# Altium project Bracelet_Aux_v1.0.PrjPcb
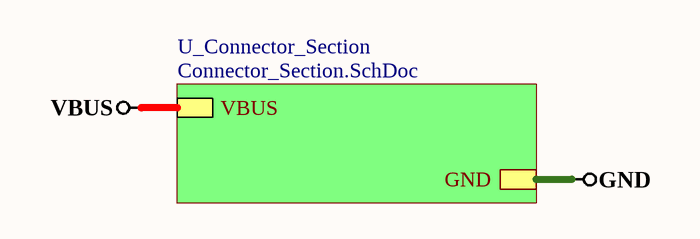
[diagram p0: Top_Sheet.SchDoc]
2 sheets, 9 parts. Net scope: hierarchical (ports join the sheet entries above them; power ports are global).
Board file: Bracelet_Aux_v1.0.PcbDoc
Sheets:
  Top_Sheet.SchDoc
    U_Connector_Section = Connector_Section.SchDoc

## Sheet Top_Sheet.SchDoc
size A4; DocumentNumber: 1; SheetNumber: 1; SheetTotal: 2

### Sub-sheets
U_Connector_Section = Connector_Section.SchDoc: GND, VBUS

## Sheet Connector_Section.SchDoc
size A4; DocumentNumber: 2; SheetNumber: 2; SheetTotal: 2
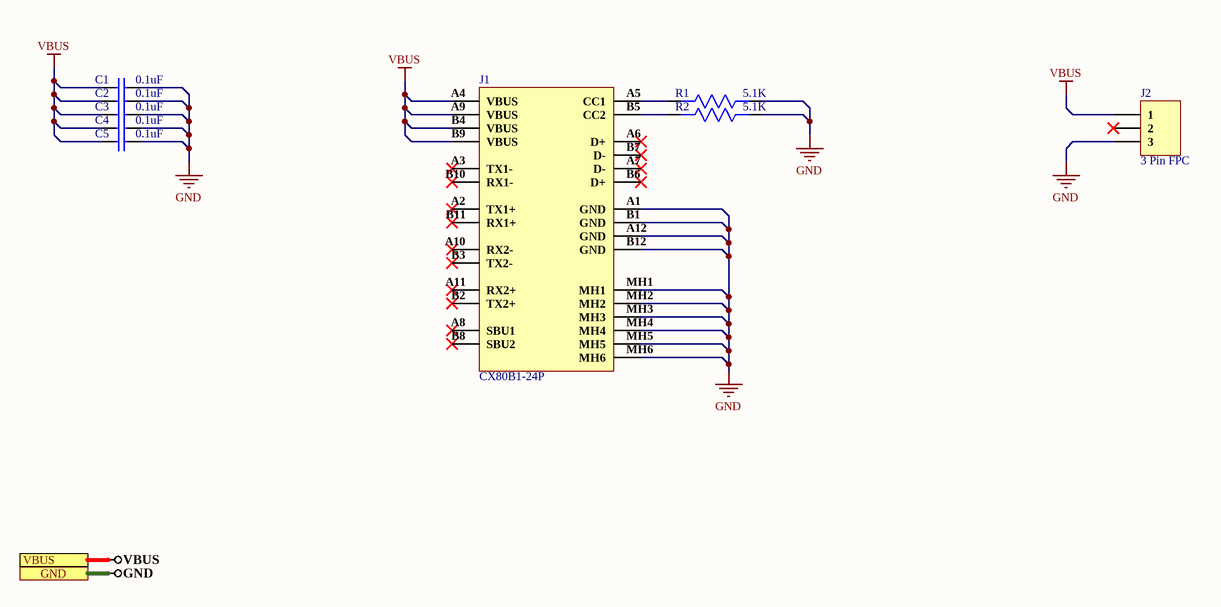
[diagram p1: Connector_Section.SchDoc]

### Parts
C1  0.1uF  [CAP 0201]
C2  0.1uF  [CAP 0201]
C3  0.1uF  [CAP 0201]
C4  0.1uF  [CAP 0201]
C5  0.1uF  [CAP 0201]
J1  CX80B1-24P  [CX80B1-24P]
J2  3 Pin FPC  [3 Pin FPC]
R1  5.1K  [Res-0201]
R2  5.1K  [Res-0201]

### Ports
GND, VBUS

### Nets
GND: C1.2 C2.2 C3.2 C4.2 C5.2 J1.A1(GND) J1.A12(GND) J1.B1(GND) J1.B12(GND) J1.MH1 J1.MH2 J1.MH3 J1.MH4 J1.MH5 J1.MH6 J2.3 R1.1 R2.1 ; port GND
VBUS: C1.1 C2.1 C3.1 C4.1 C5.1 J1.A4(VBUS) J1.A9(VBUS) J1.B4(VBUS) J1.B9(VBUS) J2.1 ; port VBUS
NetJ1_A5: J1.A5(CC1) R1.2
NetJ1_B5: J1.B5(CC2) R2.2

Not connected (* = marked no-connect by the designer): J1 A2(TX1+)* A3(TX1-)* A6(D+)* A7(D-)* A8(SBU1)* A10(RX2-)* A11(RX2+)* B2(TX2+)* B3(TX2-)* B6(D+)* B7(D-)* B8(SBU2)* B10(RX1-)* B11(RX1+)*; J2 2*

### Library data of the parts
C1-C5 = GRM033R61E104KE14D: Multilayer Ceramic Capacitors MLCC - SMD/SMT 0201 0.1uF 25volts X5R 10%; Manufacturer: Murata; Capacitance: 100nF; Voltage Rating: 25V; Supplier 1: Mouser; Manufacturer Part Number: GRM033R61E104KE14D; RoHS: Yes; Category: Ceramic Capacitors; Stock 1: 22478; Pricing 1: 1=0.10000, 10=0.03100, 50=0.03100, 100=0.02500, 1000=0.01700, 10000=0.01400 (USD); Mount: Surface Mount; Case/Package: 0201; Case Code (Metric): 0603; Case Code (Imperial): 0201; Weight: 1.2E-05oz; Min Operating Temperature: -55°C; Max Operating Temperature: 85°C; Packaging: Tape and Reel; Tolerance: 10%; Dielectric: X5R; Termination: SMD/SMT; Resistor Type: Ceramic; Voltage Rating (DC): 25V; Package Quantity: 15000; Length: 0.024inch; Width: 0.012inch; Height: 0.3mm; Thickness: 0.013inch; Lead Free: Lead Free; RoHS Compliant: Yes; ComponentLink1URL: http://www.farnell.com/datasheets/2867843.pdf?src-supplier=Farnell; ComponentLink1Description: http://www.farnell.com/datasheets/2867843.pdf?src-supplier=Farnell; ComponentLink2URL: http://www.mouser.com/ds/2/281/c02e-2905.pdf?src-supplier=Mouser; ComponentLink2Description: http://www.mouser.com/ds/2/281/c02e-2905.pdf?src-supplier=Mouser; ComponentLink3URL: http://search.murata.co.jp/Ceramy/image/img/A01X/G101/ENG/GRM033R61E104KE14-01.pdf?src-supplier=Digi-Key; ComponentLink3Description: http://search.murata.co.jp/Ceramy/image/img/A01X/G101/ENG/GRM033R61E104KE14-01.pdf?src-supplier=Digi-Key; ComponentLink4URL: http://www.farnell.com/datasheets/2867843.pdf?src-supplier=Newark; ComponentLink4Description: http://www.farnell.com/datasheets/2867843.pdf?src-supplier=Newark; Supplier Part Number 1: 81-GRM033R61E104KE4D
J1 = CX80B1-24P: CONN RCPT USB3.1 TYPE C SMT VERT; Manufacturer: Hirose; Connector Type: USB; Number of Contacts: 24; Gender: Receptacle; Number of Ports: 1; Current Rating: 1.25A; Mating Cycles: 10000; Shielding: Shielded; Supplier 1: Digi-Key; Manufacturer Part Number: CX80B1-24P; RoHS: Yes; Category: Connectors; Stock 1: 1; Pricing 1: 1=3.23000, 10=3.09600, 25=2.83800, 50=2.70900, 100=2.58000, 250=2.25752 (USD); Mount: Surface Mount,Through Hole; Contact Plating: Gold; Insulation Color: Black; Min Operating Temperature: -40°C; Max Operating Temperature: 85°C; Packaging: Cut Tape; Termination: Solder; Flammability Rating: UL94 V-0; ComponentLink1URL: https://www.hirose.com/product/download/?distributor=digikey&amp;type=2d&amp;lang=en&amp;num=CX80B1-24P&src-supplier=Digi-Key; ComponentLink1Description: https://www.hirose.com/product/download/?distributor=digikey&amp;type=2d&amp;lang=en&amp;num=CX80B1-24P&src-supplier=Digi-Key; Supplier Part Number 1: 26-CX80B1-24PCT-ND
J2 = 3 Pin FPC: CONN FPC 3POS 0.5MM SMD R/A; ComponentLink1URL: https://www.molex.com/pdm_docs/pk/5051479200-200.pdf?src-supplier=Digi-Key; ComponentLink1Description: https://www.molex.com/pdm_docs/pk/5051479200-200.pdf?src-supplier=Digi-Key; ComponentLink2URL: http://www.molex.com/pdm_docs/sd/5051470390_sd.pdf?src-supplier=Digi-Key; ComponentLink2Description: http://www.molex.com/pdm_docs/sd/5051470390_sd.pdf?src-supplier=Digi-Key; ComponentLink3URL: https://www.molex.com/pdm_docs/sd/5051470390_sd.pdf?src-supplier=Digi-Key; ComponentLink3Description: https://www.molex.com/pdm_docs/sd/5051470390_sd.pdf?src-supplier=Digi-Key
R1 R2 = WR02X512JAL: Res 5.1K Ohm 5% 1/20W 0201; Manufacturer: Walsin Technologies; Supplier 1: DigiKey; Manufacturer Part Number: WR02X512JAL; Pricing 1: 15000=0.00209 (USD); RoHS Compliant: Yes; Supplier Part Number 1: 1292-WR02X512JALTR-ND